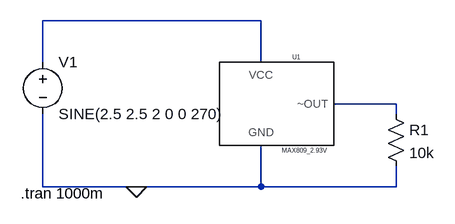
[diagram p0: schematic max809.asc]
max809.asc, the LTspice schematic file:
Version 4
SHEET 1 880 680
WIRE 144 48 -192 48
WIRE -192 112 -192 48
WIRE 144 112 144 48
WIRE 352 176 256 176
WIRE 352 192 352 176
WIRE -192 304 -192 192
WIRE -48 304 -192 304
WIRE 144 304 144 240
WIRE 144 304 -48 304
WIRE 352 304 352 272
WIRE 352 304 144 304
FLAG -48 304 0
SYMBOL MAX809_2.93V 144 176 R0
SYMATTR InstName U1
SYMBOL voltage -192 96 R0
WINDOW 123 0 0 Left 0
WINDOW 39 0 0 Left 0
SYMATTR InstName V1
SYMATTR Value SINE(2.5 2.5 2 0 0 270)
SYMBOL res 336 176 R0
SYMATTR InstName R1
SYMATTR Value 10k
TEXT -226 314 Left 2 !.tran 1000m

The netlist it stands for:
* max809.asc
XU1 0 N002 N001 MAX809_2.93V  ; pins GND ~OUT VCC
V1 N001 0 SINE(2.5 2.5 2 0 0 270)
R1 N002 0 10k
.tran 1000m
.lib MAX809.lib
.backanno
.end